# EAGLE design PinballCounter (EAGLE 9.6.2)
8-digit individually-triggered 74LS TTL pinball score counter

## Sheet 1 of 3
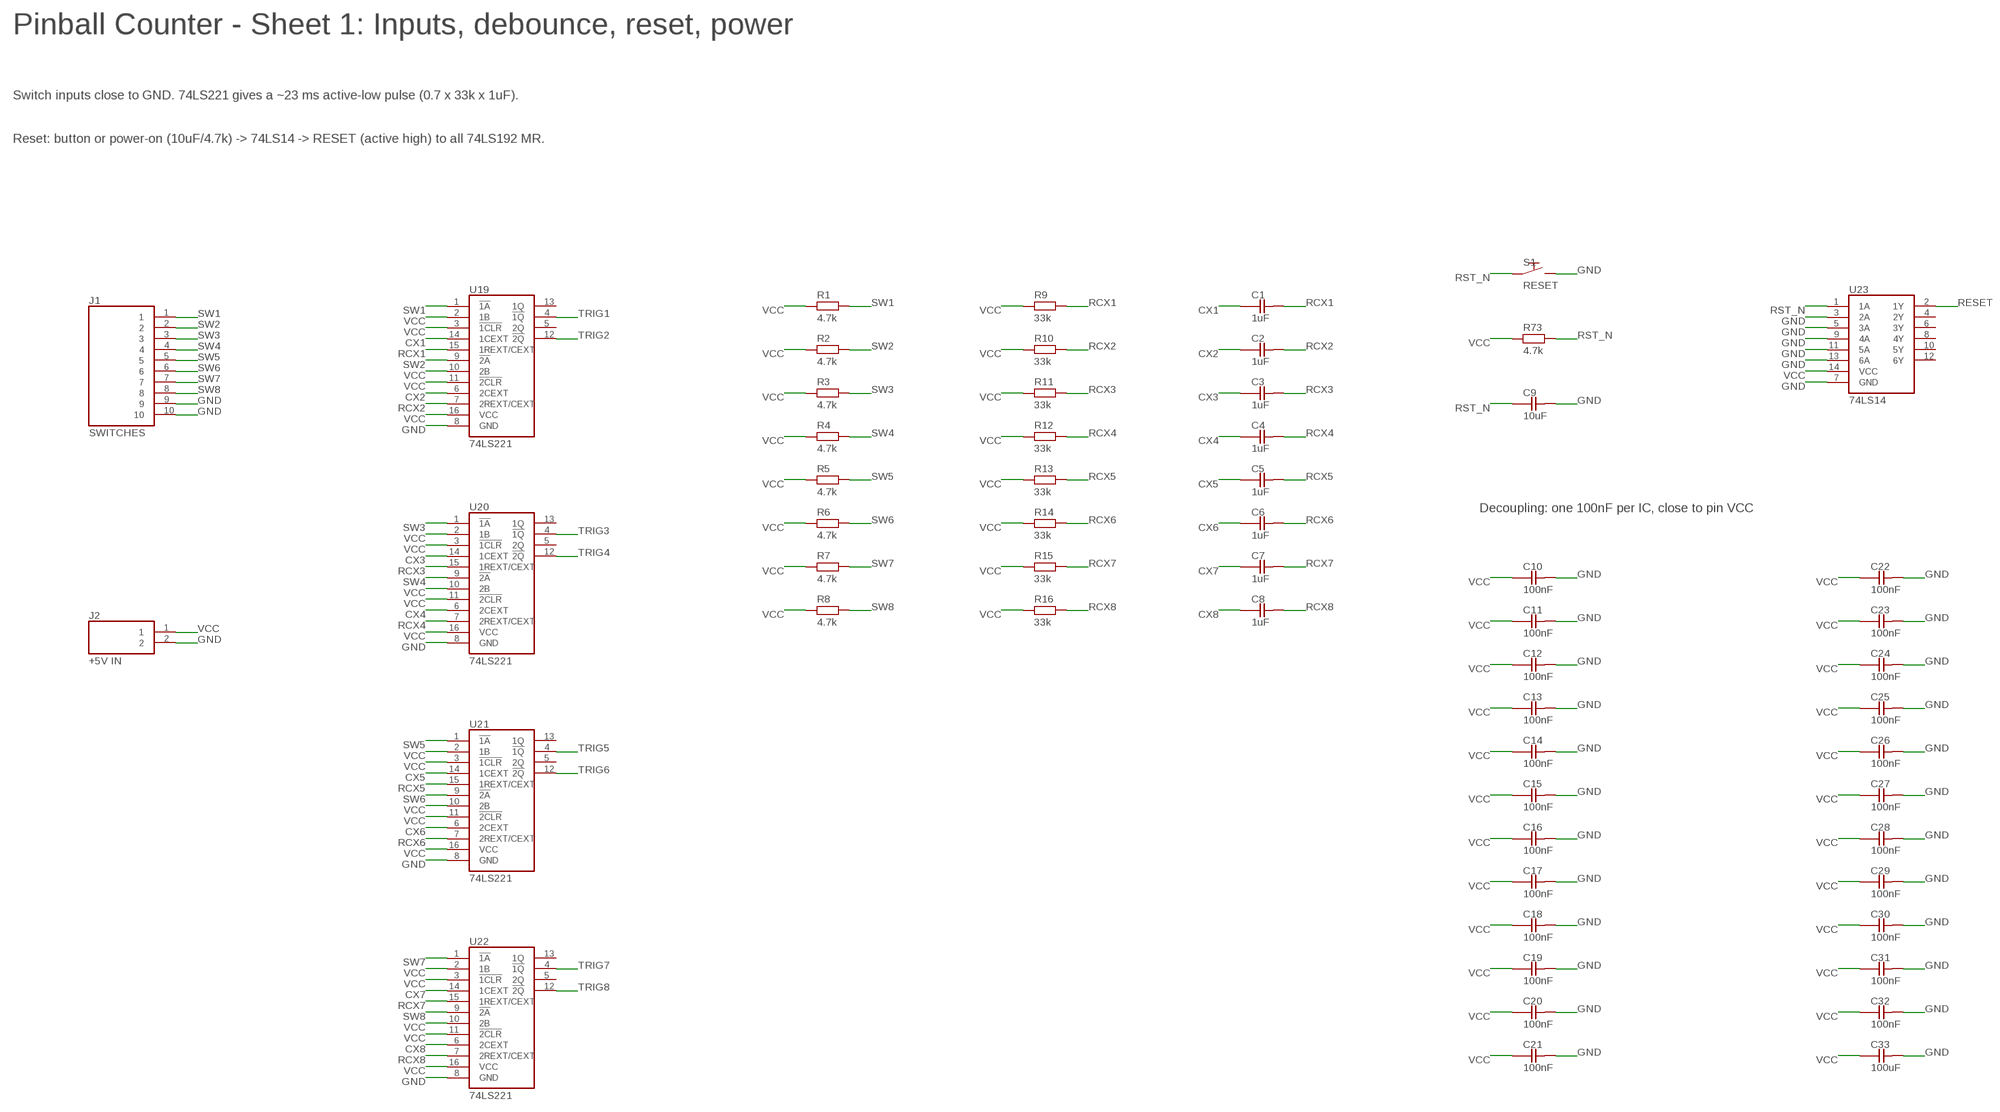
[diagram p0: schematic, sheet 1]

### Parts
C1  1uF  C  [C2.5]
C2  1uF  C  [C2.5]
C3  1uF  C  [C2.5]
C4  1uF  C  [C2.5]
C5  1uF  C  [C2.5]
C6  1uF  C  [C2.5]
C7  1uF  C  [C2.5]
C8  1uF  C  [C2.5]
C9  10uF  CPOL  [E2.5-6]
C10  100nF  C  [C2.5]
C11  100nF  C  [C2.5]
C12  100nF  C  [C2.5]
C13  100nF  C  [C2.5]
C14  100nF  C  [C2.5]
C15  100nF  C  [C2.5]
C16  100nF  C  [C2.5]
C17  100nF  C  [C2.5]
C18  100nF  C  [C2.5]
C19  100nF  C  [C2.5]
C20  100nF  C  [C2.5]
C21  100nF  C  [C2.5]
C22  100nF  C  [C2.5]
C23  100nF  C  [C2.5]
C24  100nF  C  [C2.5]
C25  100nF  C  [C2.5]
C26  100nF  C  [C2.5]
C27  100nF  C  [C2.5]
C28  100nF  C  [C2.5]
C29  100nF  C  [C2.5]
C30  100nF  C  [C2.5]
C31  100nF  C  [C2.5]
C32  100nF  C  [C2.5]
C33  100uF  CPOL  [E2.5-6]
J1  SWITCHES  HEADER-10  [1X10]
J2  +5V IN  HEADER-2  [1X02]
R1  4.7k  R  [0207/10]
R2  4.7k  R  [0207/10]
R3  4.7k  R  [0207/10]
R4  4.7k  R  [0207/10]
R5  4.7k  R  [0207/10]
R6  4.7k  R  [0207/10]
R7  4.7k  R  [0207/10]
R8  4.7k  R  [0207/10]
R9  33k  R  [0207/10]
R10  33k  R  [0207/10]
R11  33k  R  [0207/10]
R12  33k  R  [0207/10]
R13  33k  R  [0207/10]
R14  33k  R  [0207/10]
R15  33k  R  [0207/10]
R16  33k  R  [0207/10]
R73  4.7k  R  [0207/10]
S1  RESET  PUSHBUTTON  [TACT6MM]
U19  74LS221  74LS221N  [DIP16]
U20  74LS221  74LS221N  [DIP16]
U21  74LS221  74LS221N  [DIP16]
U22  74LS221  74LS221N  [DIP16]
U23  74LS14  74LS14N  [DIP14]

### Nets
CX1: C1.1 U19.14(1CEXT)
CX2: C2.1 U19.6(2CEXT)
CX3: C3.1 U20.14(1CEXT)
CX4: C4.1 U20.6(2CEXT)
CX5: C5.1 U21.14(1CEXT)
CX6: C6.1 U21.6(2CEXT)
CX7: C7.1 U22.14(1CEXT)
CX8: C8.1 U22.6(2CEXT)
GND [power]: C9.2 C10.2 C11.2 C12.2 C13.2 C14.2 C15.2 C16.2 C17.2 C18.2 C19.2 C20.2 C21.2 C22.2 C23.2 C24.2 C25.2 C26.2 C27.2 C28.2 C29.2 C30.2 C31.2 C32.2 C33.2 J1.9 J1.10 J2.2 S1.3 S1.4 U19.8(GND) U20.8(GND) U21.8(GND) U22.8(GND) U23.3(2A) U23.5(3A) U23.7(GND) U23.9(4A) U23.11(5A) U23.13(6A) ; also sheet 2,3
RCX1: C1.2 R9.2 U19.15(1REXT/CEXT)
RCX2: C2.2 R10.2 U19.7(2REXT/CEXT)
RCX3: C3.2 R11.2 U20.15(1REXT/CEXT)
RCX4: C4.2 R12.2 U20.7(2REXT/CEXT)
RCX5: C5.2 R13.2 U21.15(1REXT/CEXT)
RCX6: C6.2 R14.2 U21.7(2REXT/CEXT)
RCX7: C7.2 R15.2 U22.15(1REXT/CEXT)
RCX8: C8.2 R16.2 U22.7(2REXT/CEXT)
RESET: U23.2(1Y) ; also sheet 2
RST_N: C9.1 R73.2 S1.1 S1.2 U23.1(1A)
SW1: J1.1 R1.2 U19.1(!1A)
SW2: J1.2 R2.2 U19.9(!2A)
SW3: J1.3 R3.2 U20.1(!1A)
SW4: J1.4 R4.2 U20.9(!2A)
SW5: J1.5 R5.2 U21.1(!1A)
SW6: J1.6 R6.2 U21.9(!2A)
SW7: J1.7 R7.2 U22.1(!1A)
SW8: J1.8 R8.2 U22.9(!2A)
TRIG1: U19.4(!1Q) ; also sheet 2
TRIG2: U19.12(!2Q) ; also sheet 2
TRIG3: U20.4(!1Q) ; also sheet 2
TRIG4: U20.12(!2Q) ; also sheet 2
TRIG5: U21.4(!1Q) ; also sheet 2
TRIG6: U21.12(!2Q) ; also sheet 2
TRIG7: U22.4(!1Q) ; also sheet 2
TRIG8: U22.12(!2Q) ; also sheet 2
VCC [power]: C10.1 C11.1 C12.1 C13.1 C14.1 C15.1 C16.1 C17.1 C18.1 C19.1 C20.1 C21.1 C22.1 C23.1 C24.1 C25.1 C26.1 C27.1 C28.1 C29.1 C30.1 C31.1 C32.1 C33.1 J2.1 R1.1 R2.1 R3.1 R4.1 R5.1 R6.1 R7.1 R8.1 R9.1 R10.1 R11.1 R12.1 R13.1 R14.1 R15.1 R16.1 R73.1 U19.2(1B) U19.3(!1CLR) U19.10(2B) U19.11(!2CLR) U19.16(VCC) U20.2(1B) U20.3(!1CLR) U20.10(2B) U20.11(!2CLR) U20.16(VCC) U21.2(1B) U21.3(!1CLR) U21.10(2B) U21.11(!2CLR) U21.16(VCC) U22.2(1B) U22.3(!1CLR) U22.10(2B) U22.11(!2CLR) U22.16(VCC) U23.14(VCC) ; also sheet 2,3
Unconnected: U19.5(2Q) U19.13(1Q) U20.5(2Q) U20.13(1Q) U21.5(2Q) U21.13(1Q) U22.5(2Q) U22.13(1Q) U23.4(2Y) U23.6(3Y) U23.8(4Y) U23.10(5Y) U23.12(6Y)

### Notes on the sheet
- Pinball Counter - Sheet 1: Inputs, debounce, reset, power
- Switch inputs close to GND. 74LS221 gives a ~23 ms active-low pulse (0.7 x 33k x 1uF).
- Reset: button or power-on (10uF/4.7k) -> 74LS14 -> RESET (active high) to all 74LS192 MR.
- Decoupling: one 100nF per IC, close to pin VCC

## Sheet 2 of 3
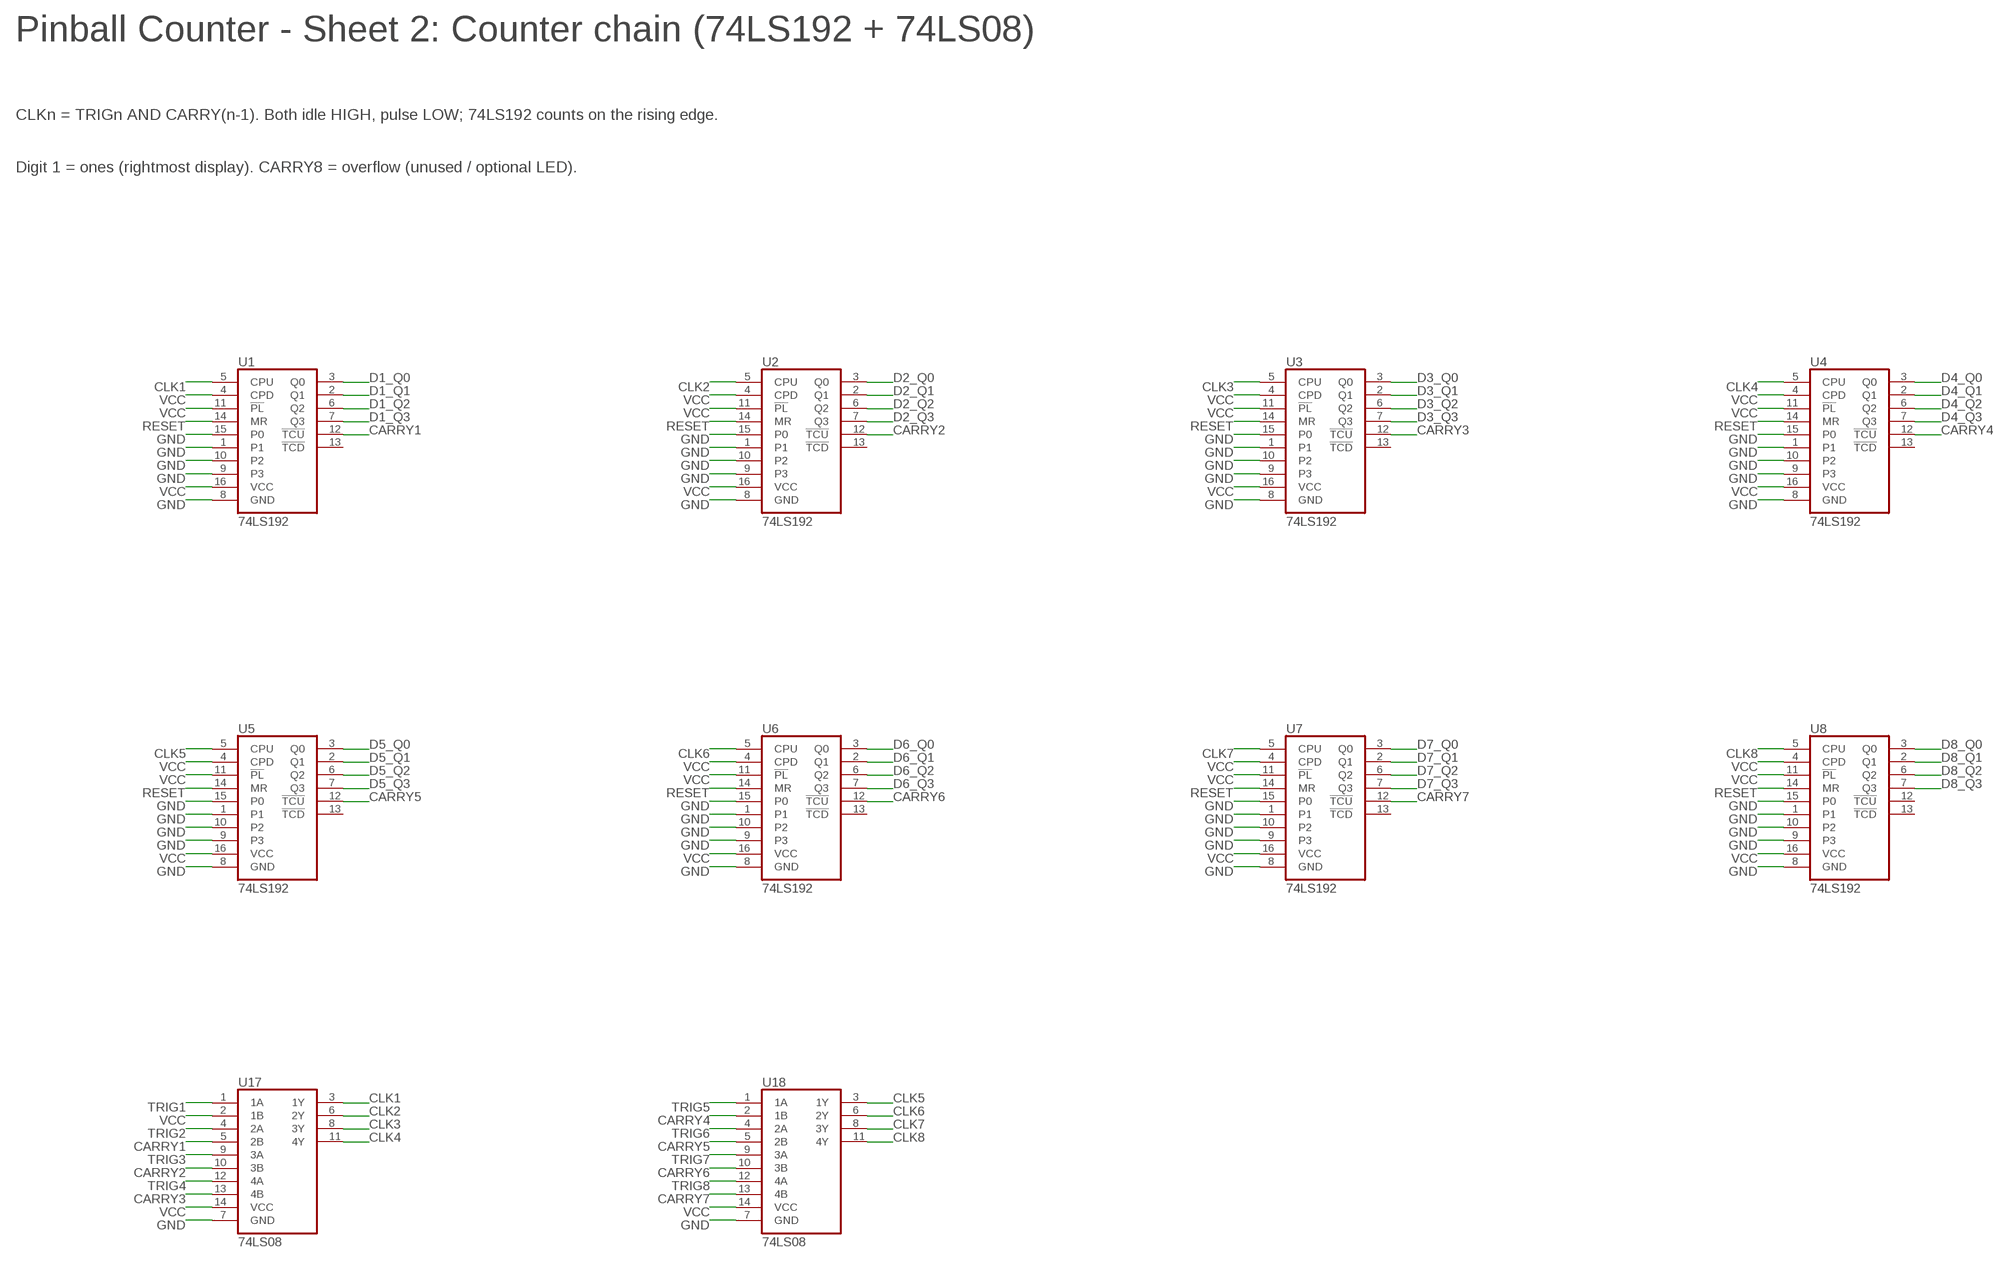
[diagram p1: schematic, sheet 2]

### Parts
U1  74LS192  74LS192N  [DIP16]
U2  74LS192  74LS192N  [DIP16]
U3  74LS192  74LS192N  [DIP16]
U4  74LS192  74LS192N  [DIP16]
U5  74LS192  74LS192N  [DIP16]
U6  74LS192  74LS192N  [DIP16]
U7  74LS192  74LS192N  [DIP16]
U8  74LS192  74LS192N  [DIP16]
U17  74LS08  74LS08N  [DIP14]
U18  74LS08  74LS08N  [DIP14]

### Nets
CARRY1: U1.12(!TCU) U17.5(2B)
CARRY2: U2.12(!TCU) U17.10(3B)
CARRY3: U3.12(!TCU) U17.13(4B)
CARRY4: U4.12(!TCU) U18.2(1B)
CARRY5: U5.12(!TCU) U18.5(2B)
CARRY6: U6.12(!TCU) U18.10(3B)
CARRY7: U7.12(!TCU) U18.13(4B)
CLK1: U1.5(CPU) U17.3(1Y)
CLK2: U2.5(CPU) U17.6(2Y)
CLK3: U3.5(CPU) U17.8(3Y)
CLK4: U4.5(CPU) U17.11(4Y)
CLK5: U5.5(CPU) U18.3(1Y)
CLK6: U6.5(CPU) U18.6(2Y)
CLK7: U7.5(CPU) U18.8(3Y)
CLK8: U8.5(CPU) U18.11(4Y)
D1_Q0: U1.3(Q0) ; also sheet 3
D1_Q1: U1.2(Q1) ; also sheet 3
D1_Q2: U1.6(Q2) ; also sheet 3
D1_Q3: U1.7(Q3) ; also sheet 3
D2_Q0: U2.3(Q0) ; also sheet 3
D2_Q1: U2.2(Q1) ; also sheet 3
D2_Q2: U2.6(Q2) ; also sheet 3
D2_Q3: U2.7(Q3) ; also sheet 3
D3_Q0: U3.3(Q0) ; also sheet 3
D3_Q1: U3.2(Q1) ; also sheet 3
D3_Q2: U3.6(Q2) ; also sheet 3
D3_Q3: U3.7(Q3) ; also sheet 3
D4_Q0: U4.3(Q0) ; also sheet 3
D4_Q1: U4.2(Q1) ; also sheet 3
D4_Q2: U4.6(Q2) ; also sheet 3
D4_Q3: U4.7(Q3) ; also sheet 3
D5_Q0: U5.3(Q0) ; also sheet 3
D5_Q1: U5.2(Q1) ; also sheet 3
D5_Q2: U5.6(Q2) ; also sheet 3
D5_Q3: U5.7(Q3) ; also sheet 3
D6_Q0: U6.3(Q0) ; also sheet 3
D6_Q1: U6.2(Q1) ; also sheet 3
D6_Q2: U6.6(Q2) ; also sheet 3
D6_Q3: U6.7(Q3) ; also sheet 3
D7_Q0: U7.3(Q0) ; also sheet 3
D7_Q1: U7.2(Q1) ; also sheet 3
D7_Q2: U7.6(Q2) ; also sheet 3
D7_Q3: U7.7(Q3) ; also sheet 3
D8_Q0: U8.3(Q0) ; also sheet 3
D8_Q1: U8.2(Q1) ; also sheet 3
D8_Q2: U8.6(Q2) ; also sheet 3
D8_Q3: U8.7(Q3) ; also sheet 3
GND [power]: U1.1 U1.8(GND) U1.9(P3) U1.10(P2) U1.15(P0) U2.1 U2.8(GND) U2.9(P3) U2.10(P2) U2.15(P0) U3.1 U3.8(GND) U3.9(P3) U3.10(P2) U3.15(P0) U4.1 U4.8(GND) U4.9(P3) U4.10(P2) U4.15(P0) U5.1 U5.8(GND) U5.9(P3) U5.10(P2) U5.15(P0) U6.1 U6.8(GND) U6.9(P3) U6.10(P2) U6.15(P0) U7.1 U7.8(GND) U7.9(P3) U7.10(P2) U7.15(P0) U8.1 U8.8(GND) U8.9(P3) U8.10(P2) U8.15(P0) U17.7(GND) U18.7(GND) ; also sheet 1,3
RESET: U1.14(MR) U2.14(MR) U3.14(MR) U4.14(MR) U5.14(MR) U6.14(MR) U7.14(MR) U8.14(MR) ; also sheet 1
TRIG1: U17.1(1A) ; also sheet 1
TRIG2: U17.4(2A) ; also sheet 1
TRIG3: U17.9(3A) ; also sheet 1
TRIG4: U17.12(4A) ; also sheet 1
TRIG5: U18.1(1A) ; also sheet 1
TRIG6: U18.4(2A) ; also sheet 1
TRIG7: U18.9(3A) ; also sheet 1
TRIG8: U18.12(4A) ; also sheet 1
VCC [power]: U1.4(CPD) U1.11(!PL) U1.16(VCC) U2.4(CPD) U2.11(!PL) U2.16(VCC) U3.4(CPD) U3.11(!PL) U3.16(VCC) U4.4(CPD) U4.11(!PL) U4.16(VCC) U5.4(CPD) U5.11(!PL) U5.16(VCC) U6.4(CPD) U6.11(!PL) U6.16(VCC) U7.4(CPD) U7.11(!PL) U7.16(VCC) U8.4(CPD) U8.11(!PL) U8.16(VCC) U17.2(1B) U17.14(VCC) U18.14(VCC) ; also sheet 1,3
Unconnected: U1.13(!TCD) U2.13(!TCD) U3.13(!TCD) U4.13(!TCD) U5.13(!TCD) U6.13(!TCD) U7.13(!TCD) U8.12(!TCU) U8.13(!TCD)

### Notes on the sheet
- Pinball Counter - Sheet 2: Counter chain (74LS192 + 74LS08)
- CLKn = TRIGn AND CARRY(n-1). Both idle HIGH, pulse LOW; 74LS192 counts on the rising edge.
- Digit 1 = ones (rightmost display). CARRY8 = overflow (unused / optional LED).

## Sheet 3 of 3
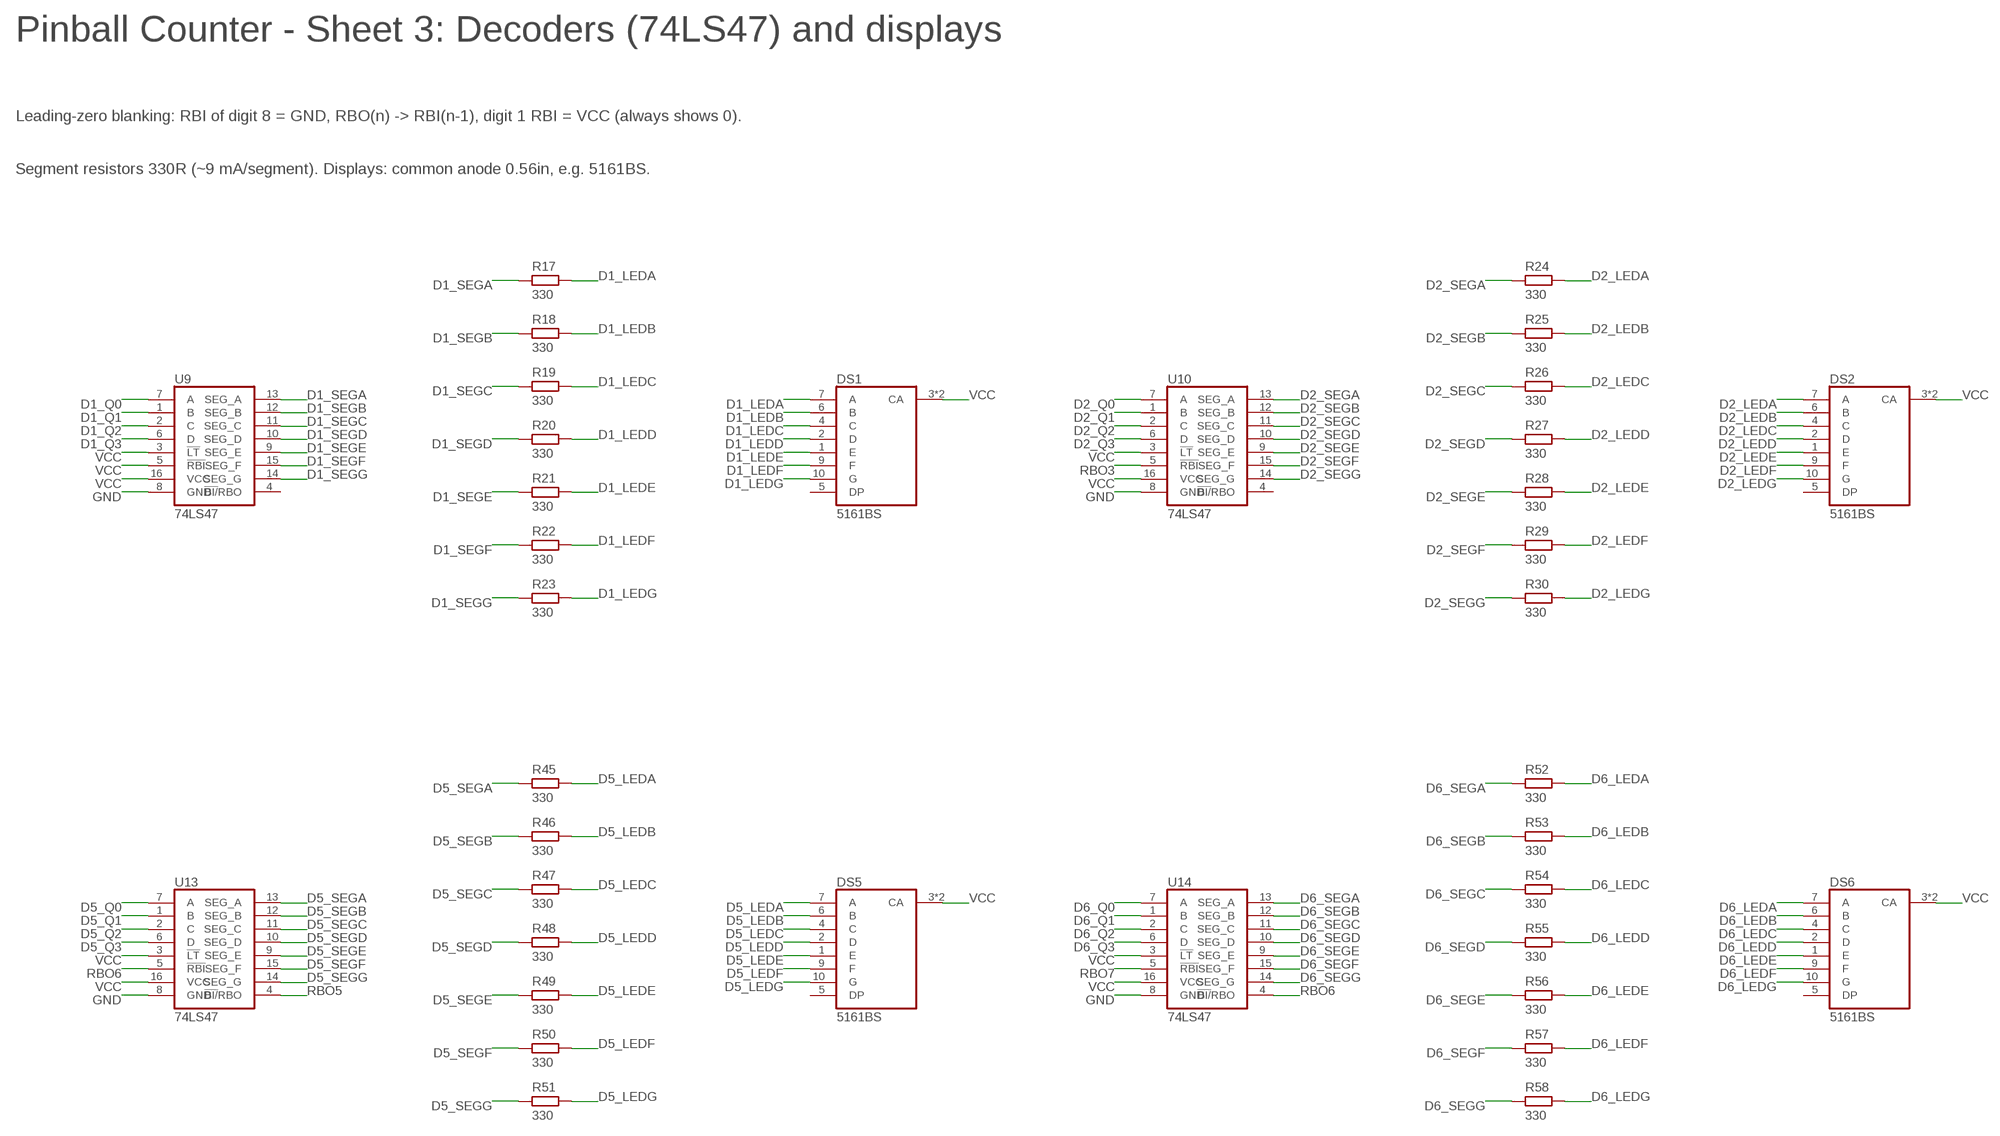
[diagram p2: schematic, sheet 3, part 1 of 2]
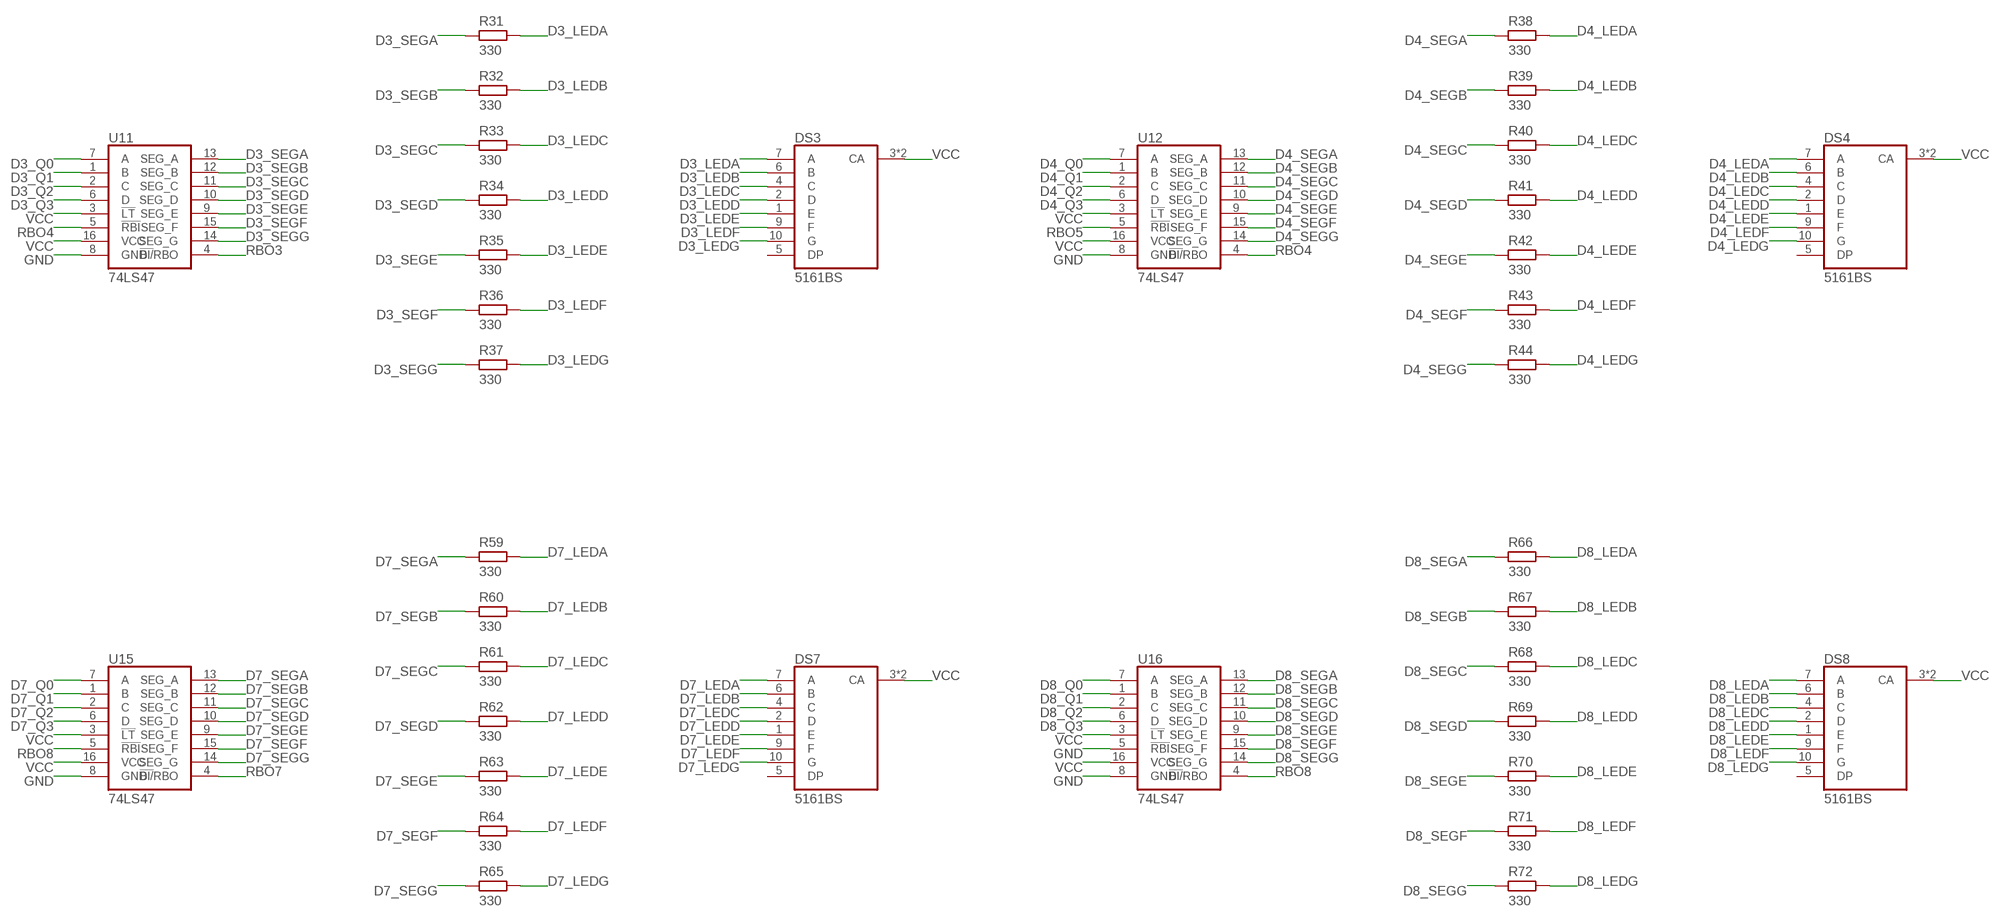
[diagram p3: schematic, sheet 3, part 2 of 2]

### Parts
DS1  5161BS  7SEG-CA  [7SEG-056]
DS2  5161BS  7SEG-CA  [7SEG-056]
DS3  5161BS  7SEG-CA  [7SEG-056]
DS4  5161BS  7SEG-CA  [7SEG-056]
DS5  5161BS  7SEG-CA  [7SEG-056]
DS6  5161BS  7SEG-CA  [7SEG-056]
DS7  5161BS  7SEG-CA  [7SEG-056]
DS8  5161BS  7SEG-CA  [7SEG-056]
R17  330  R  [0207/10]
R18  330  R  [0207/10]
R19  330  R  [0207/10]
R20  330  R  [0207/10]
R21  330  R  [0207/10]
R22  330  R  [0207/10]
R23  330  R  [0207/10]
R24  330  R  [0207/10]
R25  330  R  [0207/10]
R26  330  R  [0207/10]
R27  330  R  [0207/10]
R28  330  R  [0207/10]
R29  330  R  [0207/10]
R30  330  R  [0207/10]
R31  330  R  [0207/10]
R32  330  R  [0207/10]
R33  330  R  [0207/10]
R34  330  R  [0207/10]
R35  330  R  [0207/10]
R36  330  R  [0207/10]
R37  330  R  [0207/10]
R38  330  R  [0207/10]
R39  330  R  [0207/10]
R40  330  R  [0207/10]
R41  330  R  [0207/10]
R42  330  R  [0207/10]
R43  330  R  [0207/10]
R44  330  R  [0207/10]
R45  330  R  [0207/10]
R46  330  R  [0207/10]
R47  330  R  [0207/10]
R48  330  R  [0207/10]
R49  330  R  [0207/10]
R50  330  R  [0207/10]
R51  330  R  [0207/10]
R52  330  R  [0207/10]
R53  330  R  [0207/10]
R54  330  R  [0207/10]
R55  330  R  [0207/10]
R56  330  R  [0207/10]
R57  330  R  [0207/10]
R58  330  R  [0207/10]
R59  330  R  [0207/10]
R60  330  R  [0207/10]
R61  330  R  [0207/10]
R62  330  R  [0207/10]
R63  330  R  [0207/10]
R64  330  R  [0207/10]
R65  330  R  [0207/10]
R66  330  R  [0207/10]
R67  330  R  [0207/10]
R68  330  R  [0207/10]
R69  330  R  [0207/10]
R70  330  R  [0207/10]
R71  330  R  [0207/10]
R72  330  R  [0207/10]
U9  74LS47  74LS47N  [DIP16]
U10  74LS47  74LS47N  [DIP16]
U11  74LS47  74LS47N  [DIP16]
U12  74LS47  74LS47N  [DIP16]
U13  74LS47  74LS47N  [DIP16]
U14  74LS47  74LS47N  [DIP16]
U15  74LS47  74LS47N  [DIP16]
U16  74LS47  74LS47N  [DIP16]

### Nets
D1_LEDA: DS1.7(A) R17.2
D1_LEDB: DS1.6(B) R18.2
D1_LEDC: DS1.4(C) R19.2
D1_LEDD: DS1.2(D) R20.2
D1_LEDE: DS1.1(E) R21.2
D1_LEDF: DS1.9(F) R22.2
D1_LEDG: DS1.10(G) R23.2
D1_Q0: U9.7(A) ; also sheet 2
D1_Q1: U9.1(B) ; also sheet 2
D1_Q2: U9.2(C) ; also sheet 2
D1_Q3: U9.6(D) ; also sheet 2
D1_SEGA: R17.1 U9.13(SEG_A)
D1_SEGB: R18.1 U9.12(SEG_B)
D1_SEGC: R19.1 U9.11(SEG_C)
D1_SEGD: R20.1 U9.10(SEG_D)
D1_SEGE: R21.1 U9.9(SEG_E)
D1_SEGF: R22.1 U9.15(SEG_F)
D1_SEGG: R23.1 U9.14(SEG_G)
D2_LEDA: DS2.7(A) R24.2
D2_LEDB: DS2.6(B) R25.2
D2_LEDC: DS2.4(C) R26.2
D2_LEDD: DS2.2(D) R27.2
D2_LEDE: DS2.1(E) R28.2
D2_LEDF: DS2.9(F) R29.2
D2_LEDG: DS2.10(G) R30.2
D2_Q0: U10.7(A) ; also sheet 2
D2_Q1: U10.1(B) ; also sheet 2
D2_Q2: U10.2(C) ; also sheet 2
D2_Q3: U10.6(D) ; also sheet 2
D2_SEGA: R24.1 U10.13(SEG_A)
D2_SEGB: R25.1 U10.12(SEG_B)
D2_SEGC: R26.1 U10.11(SEG_C)
D2_SEGD: R27.1 U10.10(SEG_D)
D2_SEGE: R28.1 U10.9(SEG_E)
D2_SEGF: R29.1 U10.15(SEG_F)
D2_SEGG: R30.1 U10.14(SEG_G)
D3_LEDA: DS3.7(A) R31.2
D3_LEDB: DS3.6(B) R32.2
D3_LEDC: DS3.4(C) R33.2
D3_LEDD: DS3.2(D) R34.2
D3_LEDE: DS3.1(E) R35.2
D3_LEDF: DS3.9(F) R36.2
D3_LEDG: DS3.10(G) R37.2
D3_Q0: U11.7(A) ; also sheet 2
D3_Q1: U11.1(B) ; also sheet 2
D3_Q2: U11.2(C) ; also sheet 2
D3_Q3: U11.6(D) ; also sheet 2
D3_SEGA: R31.1 U11.13(SEG_A)
D3_SEGB: R32.1 U11.12(SEG_B)
D3_SEGC: R33.1 U11.11(SEG_C)
D3_SEGD: R34.1 U11.10(SEG_D)
D3_SEGE: R35.1 U11.9(SEG_E)
D3_SEGF: R36.1 U11.15(SEG_F)
D3_SEGG: R37.1 U11.14(SEG_G)
D4_LEDA: DS4.7(A) R38.2
D4_LEDB: DS4.6(B) R39.2
D4_LEDC: DS4.4(C) R40.2
D4_LEDD: DS4.2(D) R41.2
D4_LEDE: DS4.1(E) R42.2
D4_LEDF: DS4.9(F) R43.2
D4_LEDG: DS4.10(G) R44.2
D4_Q0: U12.7(A) ; also sheet 2
D4_Q1: U12.1(B) ; also sheet 2
D4_Q2: U12.2(C) ; also sheet 2
D4_Q3: U12.6(D) ; also sheet 2
D4_SEGA: R38.1 U12.13(SEG_A)
D4_SEGB: R39.1 U12.12(SEG_B)
D4_SEGC: R40.1 U12.11(SEG_C)
D4_SEGD: R41.1 U12.10(SEG_D)
D4_SEGE: R42.1 U12.9(SEG_E)
D4_SEGF: R43.1 U12.15(SEG_F)
D4_SEGG: R44.1 U12.14(SEG_G)
D5_LEDA: DS5.7(A) R45.2
D5_LEDB: DS5.6(B) R46.2
D5_LEDC: DS5.4(C) R47.2
D5_LEDD: DS5.2(D) R48.2
D5_LEDE: DS5.1(E) R49.2
D5_LEDF: DS5.9(F) R50.2
D5_LEDG: DS5.10(G) R51.2
D5_Q0: U13.7(A) ; also sheet 2
D5_Q1: U13.1(B) ; also sheet 2
D5_Q2: U13.2(C) ; also sheet 2
D5_Q3: U13.6(D) ; also sheet 2
D5_SEGA: R45.1 U13.13(SEG_A)
D5_SEGB: R46.1 U13.12(SEG_B)
D5_SEGC: R47.1 U13.11(SEG_C)
D5_SEGD: R48.1 U13.10(SEG_D)
D5_SEGE: R49.1 U13.9(SEG_E)
D5_SEGF: R50.1 U13.15(SEG_F)
D5_SEGG: R51.1 U13.14(SEG_G)
D6_LEDA: DS6.7(A) R52.2
D6_LEDB: DS6.6(B) R53.2
D6_LEDC: DS6.4(C) R54.2
D6_LEDD: DS6.2(D) R55.2
D6_LEDE: DS6.1(E) R56.2
D6_LEDF: DS6.9(F) R57.2
D6_LEDG: DS6.10(G) R58.2
D6_Q0: U14.7(A) ; also sheet 2
D6_Q1: U14.1(B) ; also sheet 2
D6_Q2: U14.2(C) ; also sheet 2
D6_Q3: U14.6(D) ; also sheet 2
D6_SEGA: R52.1 U14.13(SEG_A)
D6_SEGB: R53.1 U14.12(SEG_B)
D6_SEGC: R54.1 U14.11(SEG_C)
D6_SEGD: R55.1 U14.10(SEG_D)
D6_SEGE: R56.1 U14.9(SEG_E)
D6_SEGF: R57.1 U14.15(SEG_F)
D6_SEGG: R58.1 U14.14(SEG_G)
D7_LEDA: DS7.7(A) R59.2
D7_LEDB: DS7.6(B) R60.2
D7_LEDC: DS7.4(C) R61.2
D7_LEDD: DS7.2(D) R62.2
D7_LEDE: DS7.1(E) R63.2
D7_LEDF: DS7.9(F) R64.2
D7_LEDG: DS7.10(G) R65.2
D7_Q0: U15.7(A) ; also sheet 2
D7_Q1: U15.1(B) ; also sheet 2
D7_Q2: U15.2(C) ; also sheet 2
D7_Q3: U15.6(D) ; also sheet 2
D7_SEGA: R59.1 U15.13(SEG_A)
D7_SEGB: R60.1 U15.12(SEG_B)
D7_SEGC: R61.1 U15.11(SEG_C)
D7_SEGD: R62.1 U15.10(SEG_D)
D7_SEGE: R63.1 U15.9(SEG_E)
D7_SEGF: R64.1 U15.15(SEG_F)
D7_SEGG: R65.1 U15.14(SEG_G)
D8_LEDA: DS8.7(A) R66.2
D8_LEDB: DS8.6(B) R67.2
D8_LEDC: DS8.4(C) R68.2
D8_LEDD: DS8.2(D) R69.2
D8_LEDE: DS8.1(E) R70.2
D8_LEDF: DS8.9(F) R71.2
D8_LEDG: DS8.10(G) R72.2
D8_Q0: U16.7(A) ; also sheet 2
D8_Q1: U16.1(B) ; also sheet 2
D8_Q2: U16.2(C) ; also sheet 2
D8_Q3: U16.6(D) ; also sheet 2
D8_SEGA: R66.1 U16.13(SEG_A)
D8_SEGB: R67.1 U16.12(SEG_B)
D8_SEGC: R68.1 U16.11(SEG_C)
D8_SEGD: R69.1 U16.10(SEG_D)
D8_SEGE: R70.1 U16.9(SEG_E)
D8_SEGF: R71.1 U16.15(SEG_F)
D8_SEGG: R72.1 U16.14(SEG_G)
GND [power]: U9.8(GND) U10.8(GND) U11.8(GND) U12.8(GND) U13.8(GND) U14.8(GND) U15.8(GND) U16.5(!RBI) U16.8(GND) ; also sheet 1,2
RBO3: U10.5(!RBI) U11.4(!BI/!RBO)
RBO4: U11.5(!RBI) U12.4(!BI/!RBO)
RBO5: U12.5(!RBI) U13.4(!BI/!RBO)
RBO6: U13.5(!RBI) U14.4(!BI/!RBO)
RBO7: U14.5(!RBI) U15.4(!BI/!RBO)
RBO8: U15.5(!RBI) U16.4(!BI/!RBO)
VCC [power]: DS1.3(CA) DS1.8(CA) DS2.3(CA) DS2.8(CA) DS3.3(CA) DS3.8(CA) DS4.3(CA) DS4.8(CA) DS5.3(CA) DS5.8(CA) DS6.3(CA) DS6.8(CA) DS7.3(CA) DS7.8(CA) DS8.3(CA) DS8.8(CA) U9.3(!LT) U9.5(!RBI) U9.16(VCC) U10.3(!LT) U10.16(VCC) U11.3(!LT) U11.16(VCC) U12.3(!LT) U12.16(VCC) U13.3(!LT) U13.16(VCC) U14.3(!LT) U14.16(VCC) U15.3(!LT) U15.16(VCC) U16.3(!LT) U16.16(VCC) ; also sheet 1,2
Unconnected: DS1.5(DP) DS2.5(DP) DS3.5(DP) DS4.5(DP) DS5.5(DP) DS6.5(DP) DS7.5(DP) DS8.5(DP) U9.4(!BI/!RBO) U10.4(!BI/!RBO)

### Notes on the sheet
- Pinball Counter - Sheet 3: Decoders (74LS47) and displays
- Leading-zero blanking: RBI of digit 8 = GND, RBO(n) -> RBI(n-1), digit 1 RBI = VCC (always shows 0).
- Segment resistors 330R (~9 mA/segment). Displays: common anode 0.56in, e.g. 5161BS.

## Library data of the parts
C1-C8 C10-C32 = pinball_ttl:C: Capacitor, non-polarised
C9 C33 = pinball_ttl:CPOL: Electrolytic capacitor, pin 1 = +
DS1-DS8 = pinball_ttl:7SEG-CA: 0.56in common-anode 7-segment display (5161BS / SA56-11 pinout)
J1 = pinball_ttl:HEADER-10: 1x10 0.1in header
J2 = pinball_ttl:HEADER-2: 1x2 0.1in header
R1-R73 = pinball_ttl:R: Resistor
S1 = pinball_ttl:PUSHBUTTON: 6mm tactile switch
U1-U8 = pinball_ttl:74LS192: Synchronous BCD up/down decade counter
U9-U16 = pinball_ttl:74LS47: BCD to 7-segment decoder/driver, open collector
U17 U18 = pinball_ttl:74LS08: Quad 2-input AND
U19-U22 = pinball_ttl:74LS221: Dual non-retriggerable monostable
U23 = pinball_ttl:74LS14: Hex Schmitt-trigger inverter

## Net classes
0 default: width 0.305 mm
1 power: width 0.813 mm

## Board
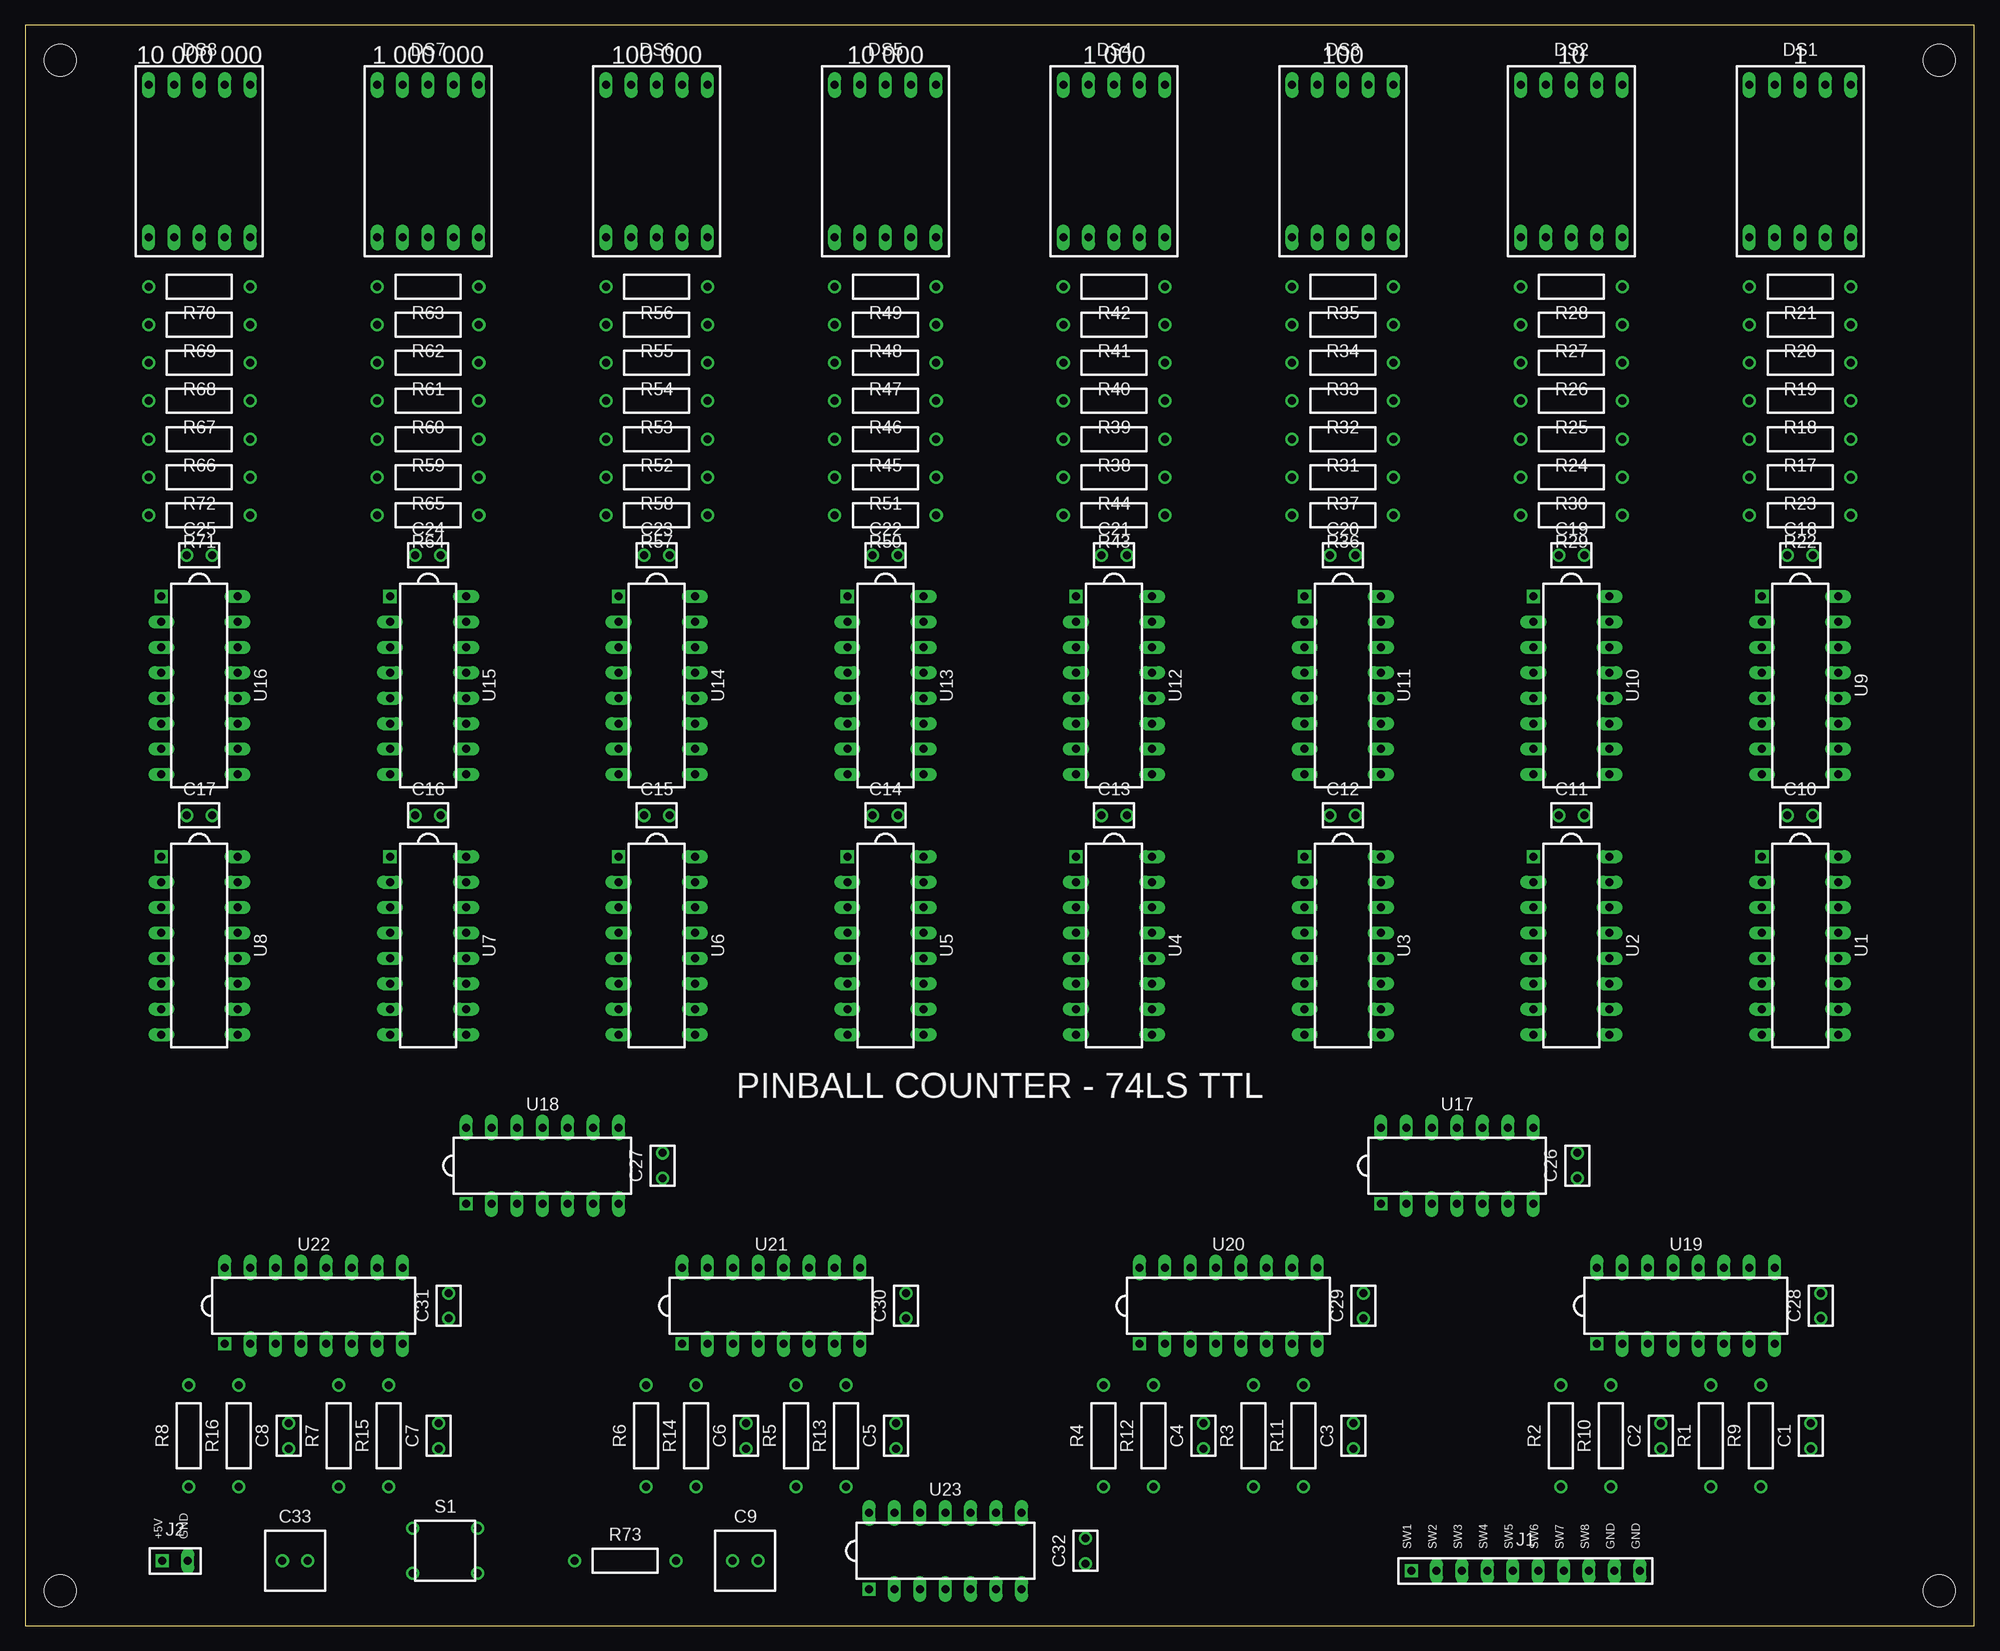
[diagram p4: board, top side]
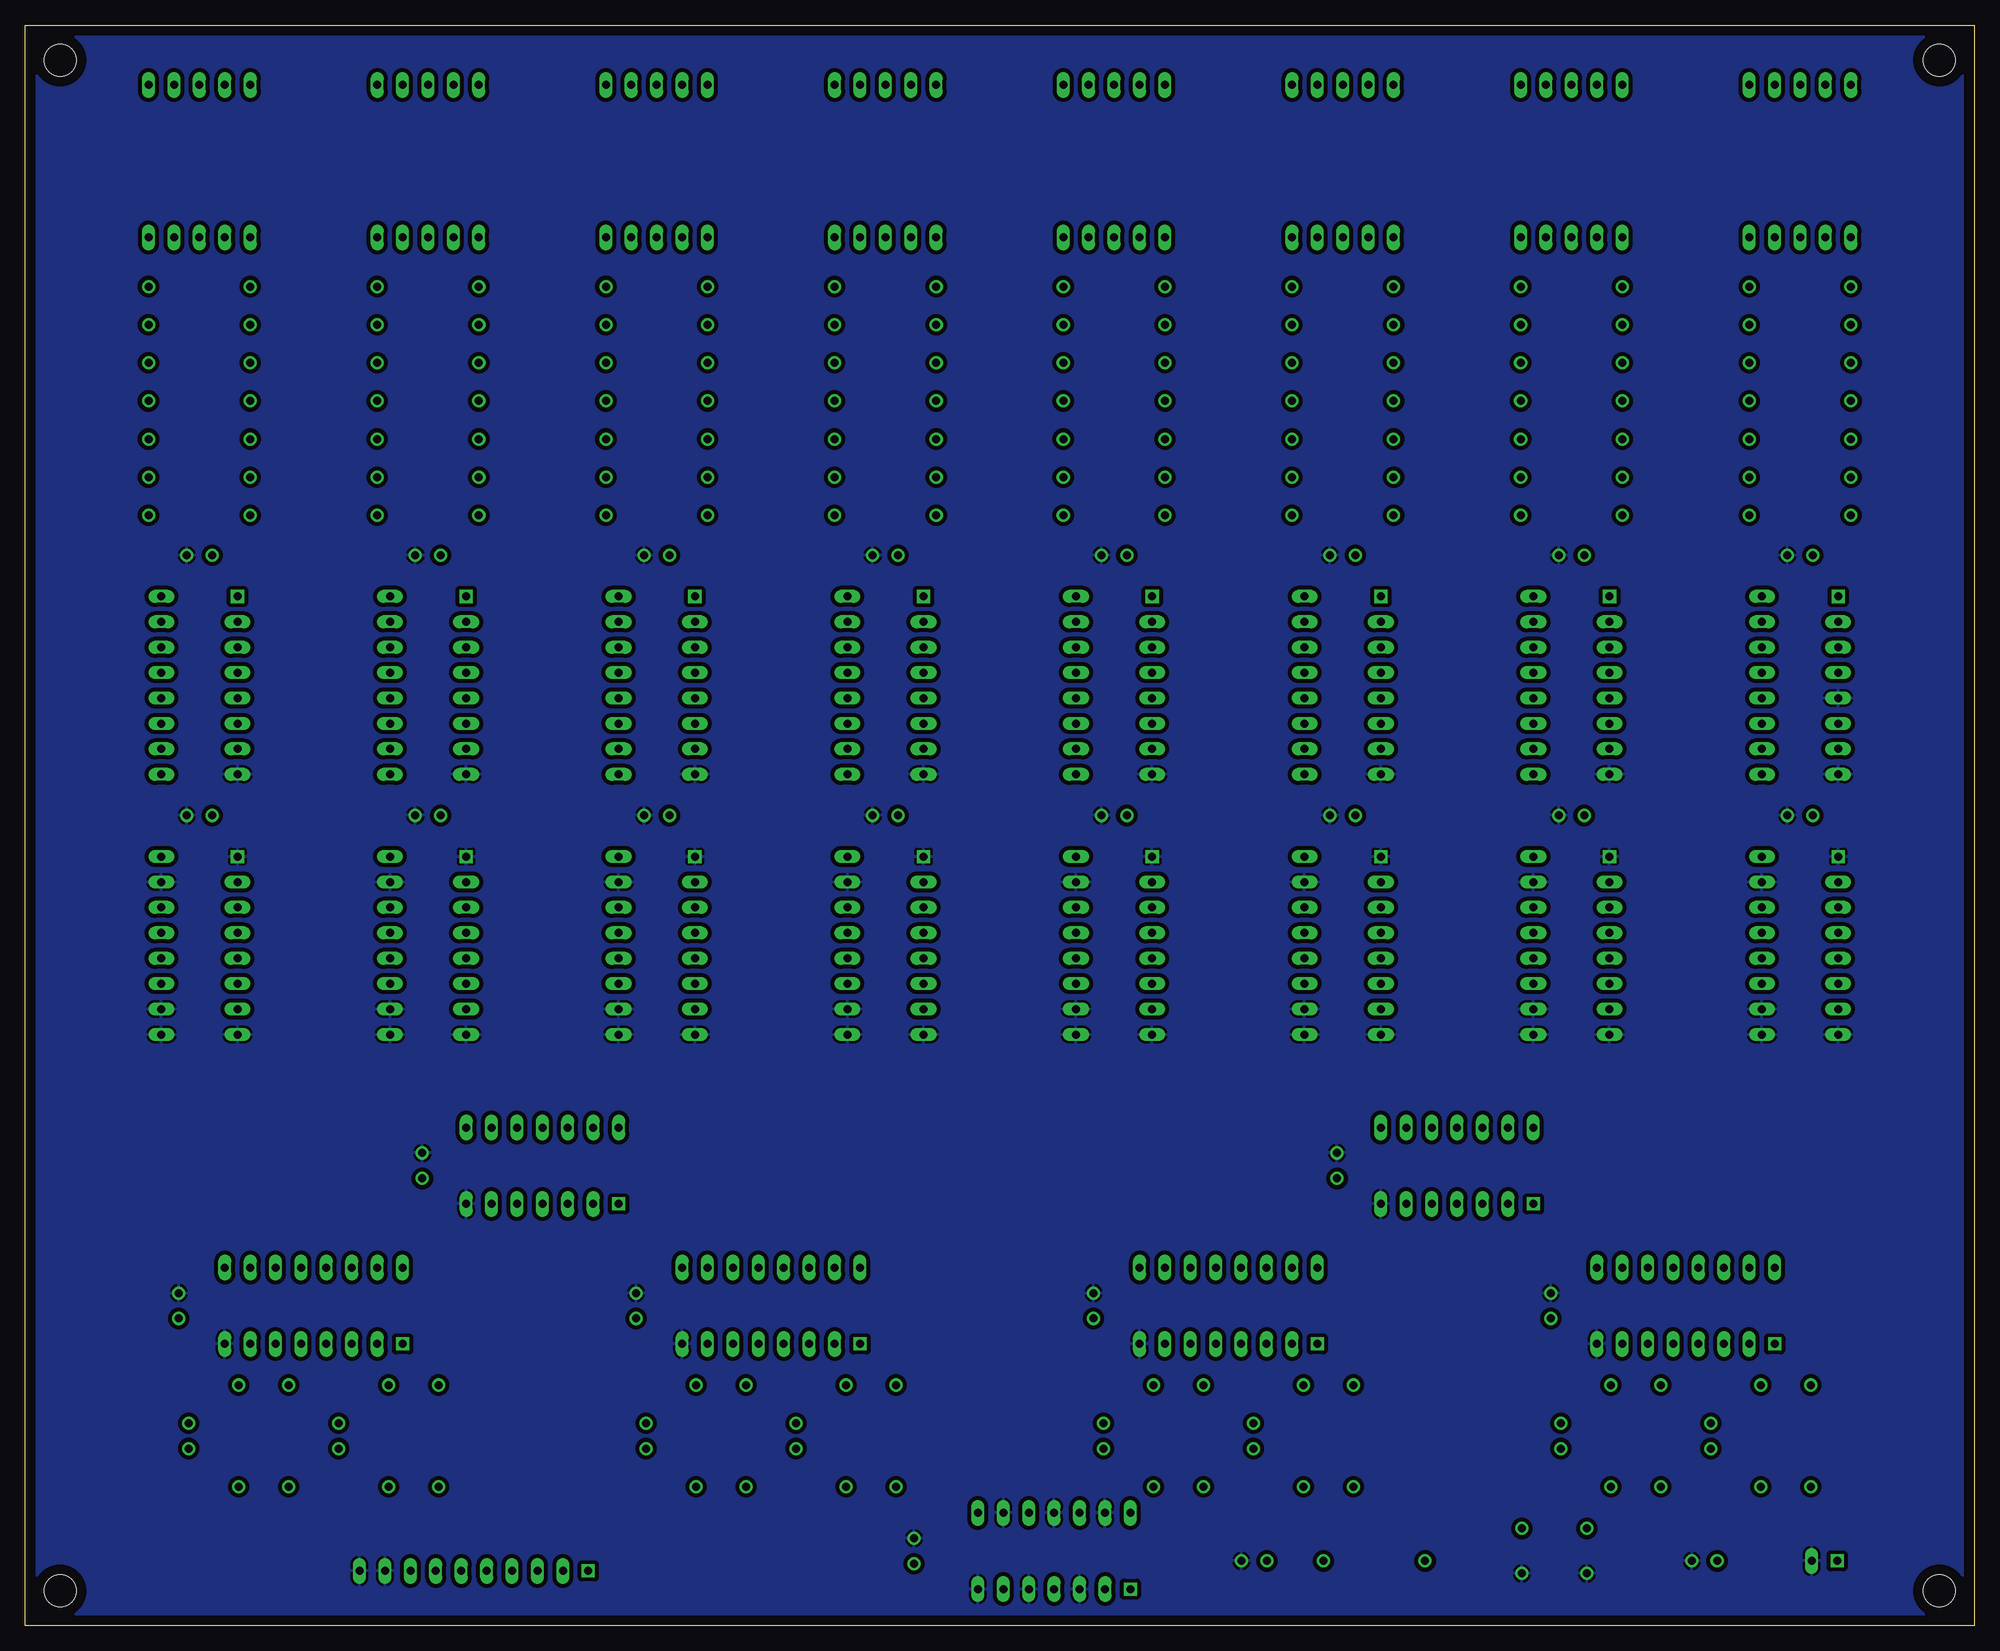
[diagram p5: board, bottom side, seen from below]

Size 194.88 x 160 mm. Coordinates in mm from the lower left corner, seen from the top.
Outline: 0,0 194.88,0 194.88,160 0,160 0,0
Copper layers used: Bottom
Holes 3.2 mm at 3.5,3.5 191.38,3.5 3.5,156.5 191.38,156.5

### Footprints (pad centres in the part's own frame; a part is rotated, then mirrored left to right if it is on the bottom)
C2.5 = drill 0.8 round: 1 -1.27,0; 2 1.27,0
E2.5-6 = drill 0.8 round: 1 -1.27,0; 2 1.27,0
7SEG-056 = drill 0.8 long: 1 -5.08,-7.62; 2 -2.54,-7.62; 3 0,-7.62; 4 2.54,-7.62; 5 5.08,-7.62; 6 5.08,7.62; 7 2.54,7.62; 8 0,7.62; 9 -2.54,7.62; 10 -5.08,7.62
1X10 = drill 0.8 square: 1 -11.43,0 | drill 0.8 long: 2 -8.89,0; 3 -6.35,0; 4 -3.81,0; 5 -1.27,0; 6 1.27,0; 7 3.81,0; 8 6.35,0; 9 8.89,0; 10 11.43,0
1X02 = drill 0.8 square: 1 -1.27,0 | drill 0.8 long: 2 1.27,0
0207/10 = drill 0.8 round: 1 -5.08,0; 2 5.08,0
TACT6MM = drill 0.8 round: 1 -3.25,2.25; 2 3.25,2.25; 3 -3.25,-2.25; 4 3.25,-2.25
DIP16 = drill 0.8 square: 1 -8.89,-3.81 | drill 0.8 long: 2 -6.35,-3.81; 3 -3.81,-3.81; 4 -1.27,-3.81; 5 1.27,-3.81; 6 3.81,-3.81; 7 6.35,-3.81; 8 8.89,-3.81; 9 8.89,3.81; 10 6.35,3.81; 11 3.81,3.81; 12 1.27,3.81; 13 -1.27,3.81; 14 -3.81,3.81; 15 -6.35,3.81; 16 -8.89,3.81
DIP14 = drill 0.8 square: 1 -7.62,-3.81 | drill 0.8 long: 2 -5.08,-3.81; 3 -2.54,-3.81; 4 0,-3.81; 5 2.54,-3.81; 6 5.08,-3.81; 7 7.62,-3.81; 8 7.62,3.81; 9 5.08,3.81; 10 2.54,3.81; 11 0,3.81; 12 -2.54,3.81; 13 -5.08,3.81; 14 -7.62,3.81

### Placement (x,y rotation side)
C1  178.52,19 90 top
C2  163.52,19 90 top
C3  132.8,19 90 top
C4  117.8,19 90 top
C5  87.08,19 90 top
C6  72.08,19 90 top
C7  41.36,19 90 top
C8  26.36,19 90 top
C9  72,6.5 0 top
C10  177.45,81 0 top
C11  154.59,81 0 top
C12  131.73,81 0 top
C13  108.87,81 0 top
C14  86.01,81 0 top
C15  63.15,81 0 top
C16  40.29,81 0 top
C17  17.43,81 0 top
C18  177.45,107 0 top
C19  154.59,107 0 top
C20  131.73,107 0 top
C21  108.87,107 0 top
C22  86.01,107 0 top
C23  63.15,107 0 top
C24  40.29,107 0 top
C25  17.43,107 0 top
C26  155.16,46 90 top
C27  63.72,46 90 top
C28  179.52,32 90 top
C29  133.8,32 90 top
C30  88.08,32 90 top
C31  42.36,32 90 top
C32  106,7.5 90 top
C33  27,6.5 0 top
DS1  177.45,146.4 0 top
DS2  154.59,146.4 0 top
DS3  131.73,146.4 0 top
DS4  108.87,146.4 0 top
DS5  86.01,146.4 0 top
DS6  63.15,146.4 0 top
DS7  40.29,146.4 0 top
DS8  17.43,146.4 0 top
J1  150,5.5 0 top
J2  15,6.5 0 top
R1  168.52,19 90 top
R2  153.52,19 90 top
R3  122.8,19 90 top
R4  107.8,19 90 top
R5  77.08,19 90 top
R6  62.08,19 90 top
R7  31.36,19 90 top
R8  16.36,19 90 top
R9  173.52,19 90 top
R10  158.52,19 90 top
R11  127.8,19 90 top
R12  112.8,19 90 top
R13  82.08,19 90 top
R14  67.08,19 90 top
R15  36.36,19 90 top
R16  21.36,19 90 top
R17  177.45,118.62 180 top
R18  177.45,122.43 180 top
R19  177.45,126.24 180 top
R20  177.45,130.05 180 top
R21  177.45,133.86 180 top
R22  177.45,111 180 top
R23  177.45,114.81 180 top
R24  154.59,118.62 180 top
R25  154.59,122.43 180 top
R26  154.59,126.24 180 top
R27  154.59,130.05 180 top
R28  154.59,133.86 180 top
R29  154.59,111 180 top
R30  154.59,114.81 180 top
R31  131.73,118.62 180 top
R32  131.73,122.43 180 top
R33  131.73,126.24 180 top
R34  131.73,130.05 180 top
R35  131.73,133.86 180 top
R36  131.73,111 180 top
R37  131.73,114.81 180 top
R38  108.87,118.62 180 top
R39  108.87,122.43 180 top
R40  108.87,126.24 180 top
R41  108.87,130.05 180 top
R42  108.87,133.86 180 top
R43  108.87,111 180 top
R44  108.87,114.81 180 top
R45  86.01,118.62 180 top
R46  86.01,122.43 180 top
R47  86.01,126.24 180 top
R48  86.01,130.05 180 top
R49  86.01,133.86 180 top
R50  86.01,111 180 top
R51  86.01,114.81 180 top
R52  63.15,118.62 180 top
R53  63.15,122.43 180 top
R54  63.15,126.24 180 top
R55  63.15,130.05 180 top
R56  63.15,133.86 180 top
R57  63.15,111 180 top
R58  63.15,114.81 180 top
R59  40.29,118.62 180 top
R60  40.29,122.43 180 top
R61  40.29,126.24 180 top
R62  40.29,130.05 180 top
R63  40.29,133.86 180 top
R64  40.29,111 180 top
R65  40.29,114.81 180 top
R66  17.43,118.62 180 top
R67  17.43,122.43 180 top
R68  17.43,126.24 180 top
R69  17.43,130.05 180 top
R70  17.43,133.86 180 top
R71  17.43,111 180 top
R72  17.43,114.81 180 top
R73  60,6.5 0 top
S1  42,7.5 0 top
U1  177.45,68 270 top
U2  154.59,68 270 top
U3  131.73,68 270 top
U4  108.87,68 270 top
U5  86.01,68 270 top
U6  63.15,68 270 top
U7  40.29,68 270 top
U8  17.43,68 270 top
U9  177.45,94 270 top
U10  154.59,94 270 top
U11  131.73,94 270 top
U12  108.87,94 270 top
U13  86.01,94 270 top
U14  63.15,94 270 top
U15  40.29,94 270 top
U16  17.43,94 270 top
U17  143.16,46 0 top
U18  51.72,46 0 top
U19  166.02,32 0 top
U20  120.3,32 0 top
U21  74.58,32 0 top
U22  28.86,32 0 top
U23  92,7.5 0 top

### Tracks (layer width: path | path; a pad name or v marks a point on that pad's centre or on a via)
GND
  pour Bottom (isolate 0.406): 0.6,0.6 194.28,0.6 194.28,159.4 0.6,159.4

### Text on the board
tPlace: 10 000 000 | 1 000 000 | 100 000 | 10 000 | 1 000 | 100 | 10 | 1 | PINBALL COUNTER - 74LS TTL | +5V | GND | SW1 | SW2 | SW3 | SW4 | SW5 | SW6 | SW7 | SW8 | GND | GND